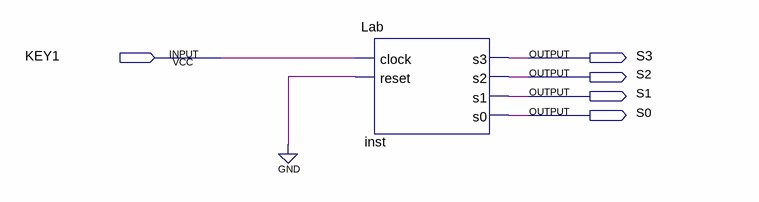
[diagram p0: schematic sheet]
// Quartus schematic Lab5.bdf as structural Verilog: 1 symbols, 5 pins
module Lab5 (
  input  KEY1,
  output S3,
  output S2,
  output S1,
  output S0
);

  Lab inst (.clock(KEY1), .reset(1'b0), .s3(S3), .s2(S2), .s1(S1), .s0(S0));
endmodule
